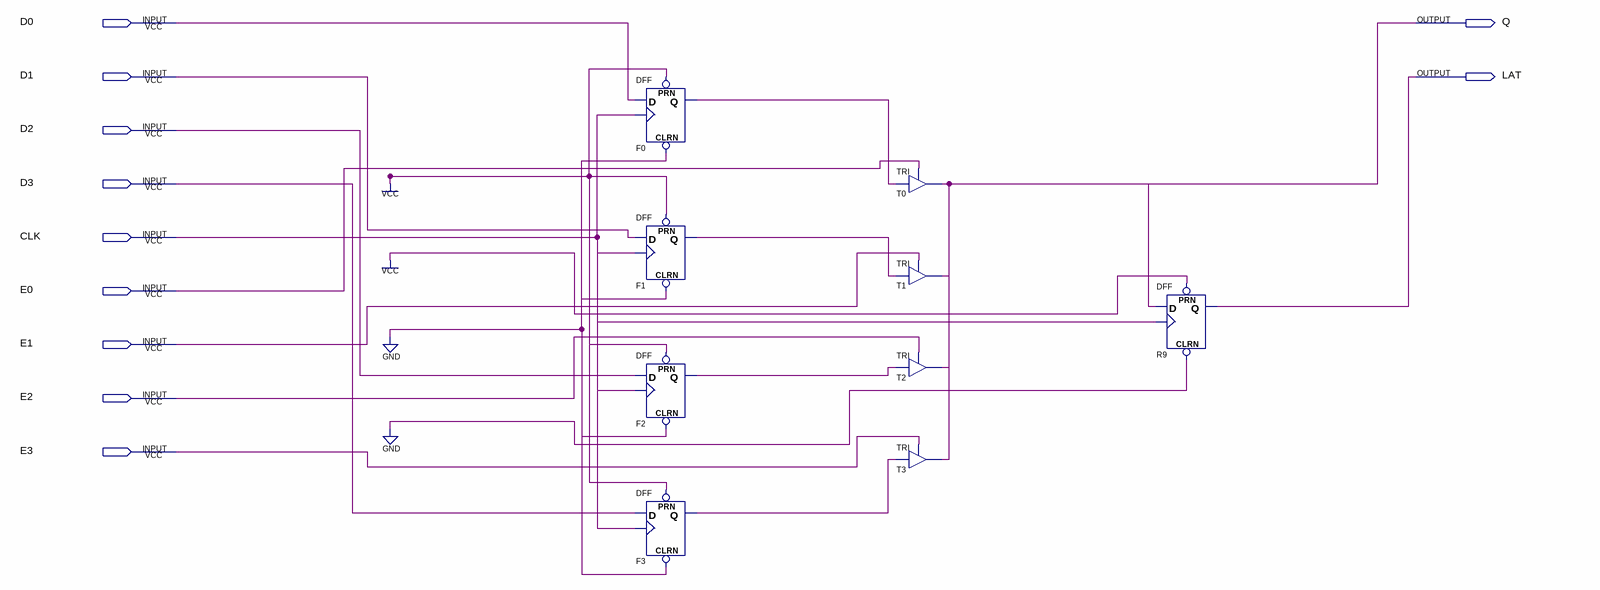
[diagram p0: schematic sheet]
// Quartus schematic TRIBUS8.bdf as structural Verilog: 9 symbols, 11 pins
module TRIBUS8 (
  input  D0,
  input  D1,
  input  D2,
  input  D3,
  input  CLK,
  input  E0,
  input  E1,
  input  E2,
  input  E3,
  output Q,
  output LAT
);

  wire F0_q, F1_q, F2_q, F3_q;

  DFF F0 (.CLRN(1'b0), .CLK(CLK), .D(D0), .PRN(1'b1), .Q(F0_q));
  DFF F1 (.CLRN(1'b0), .CLK(CLK), .D(D1), .PRN(1'b1), .Q(F1_q));
  DFF F2 (.CLRN(1'b0), .CLK(CLK), .D(D2), .PRN(1'b1), .Q(F2_q));
  DFF F3 (.CLRN(1'b0), .CLK(CLK), .D(D3), .PRN(1'b1), .Q(F3_q));
  TRI T0 (.IN(F0_q), .OE(E0), .OUT(Q));
  TRI T1 (.IN(F1_q), .OE(E1), .OUT(Q));
  TRI T2 (.IN(F2_q), .OE(E2), .OUT(Q));
  TRI T3 (.IN(F3_q), .OE(E3), .OUT(Q));
  DFF R9 (.CLRN(1'b0), .CLK(CLK), .D(Q), .PRN(1'b1), .Q(LAT));
endmodule
